# Altium schematic sheet RJ-45_CONN.SchDoc
size 420 x 297 mm; Author: Лотов М.Д.; Address1: Address1; Address2: Address2; Address3: Address3; Address4: Address4; DocumentNumber: RJ-45_CONN; SheetNumber: 4; SheetTotal: 5; Scale: 1:1; DocumentType: Схема электрическая принципиальная; FirstReferrence: АБВГ.123456.001
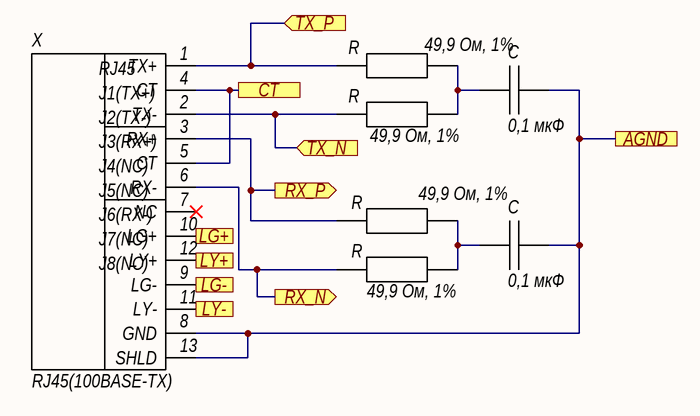
[diagram p0: RJ-45_CONN.SchDoc]

## Parts
(Parts that share a designator on the sheet are numbered #1, #2 ... from top to bottom, then left to right.)
C#1  0,1 мкФ  [C0603]
C#2  0,1 мкФ  [C0603]
R#1  49,9 Ом, 1%  [R0603]
R#2  49,9 Ом, 1%  [R0603]
R#3  49,9 Ом, 1%  [R0603]
R#4  49,9 Ом, 1%  [R0603]
X  RJ45(100BASE-TX)  [RJ-45(LPJ1004AGNL)]

## Ports
AGND, CT, LG+, LG-, LY+, LY-, RX_N (out), RX_P (out), TX_N (in), TX_P (in)

## Nets
AGND: C#1.2 C#2.2 X.8(GND) X.13(SHLD) ; port AGND
CT: X.4(CT) X.5(CT) ; port CT
LG+: X.10(LG+) ; port LG+
LG-: X.9(LG-) ; port LG-
LY+: X.12(LY+) ; port LY+
LY-: X.11(LY-) ; port LY-
RX_N: R#4.1(x) X.6(RX-) ; port RX_N
RX_P: R#3.1(x) X.3(RX+) ; port RX_P
TX_N: R#2.1(x) X.2(TX-) ; port TX_N
TX_P: R#1.1(x) X.1(TX+) ; port TX_P
NetC#1_1: C#1.1 R#1.2 R#2.2
NetC#2_1: C#2.1 R#3.2 R#4.2

Not connected (* = marked no-connect by the designer): X 7(NC)*

## Notes on the sheet
- Подп. и дата
- Инв. № дубл.
- Взам. инв. №
- Инв. № подл.
- Изм.
- Лист
- Подп.
- Дата
- 2.106-A3
- Копировал
- Формат А3
- (in symbol RJ-45 FAST Ethernet) RJ45; J1(TX+); J2(TX-); J3(RX+); J4(NC); J5(NC); J6(RX-); J7(NC); J8(NC)

## Library data of the parts
C#1 C#2 = Capacitance_SMD
R#1-R#4 = Resistor_SMD
X = RJ-45 FAST Ethernet